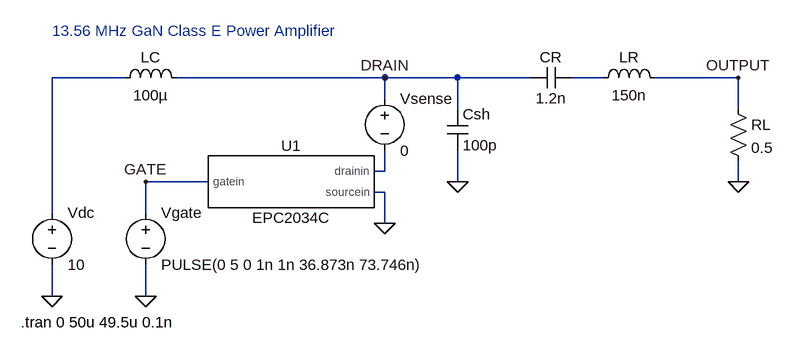
[diagram p0: schematic Class E amplifier.asc]
Class E amplifier.asc, the LTspice schematic file:
Version 4
SHEET 1 1396 680
WIRE 128 -16 16 -16
WIRE 528 -16 208 -16
WIRE 640 -16 528 -16
WIRE 752 -16 640 -16
WIRE 864 -16 816 -16
WIRE 1072 -16 944 -16
WIRE 528 16 528 -16
WIRE 640 32 640 -16
WIRE 1072 32 1072 -16
WIRE 528 128 528 96
WIRE 528 128 512 128
WIRE 256 144 160 144
WIRE 640 144 640 96
WIRE 1072 144 1072 112
WIRE 528 160 512 160
WIRE 16 192 16 -16
WIRE 160 192 160 144
WIRE 528 208 528 160
WIRE 16 320 16 272
WIRE 160 320 160 272
FLAG 160 320 0
FLAG 16 320 0
FLAG 640 144 0
FLAG 528 208 0
FLAG 1072 144 0
FLAG 528 -16 DRAIN
FLAG 160 144 GATE
FLAG 1072 -16 OUTPUT
DATAFLAG 256 -16 ""
SYMBOL voltage 160 176 R0
WINDOW 123 0 0 Left 0
WINDOW 39 0 0 Left 0
SYMATTR InstName Vgate
SYMATTR Value PULSE(0 5 0 1n 1n 36.873n 73.746n)
SYMBOL voltage 16 176 R0
WINDOW 123 0 0 Left 0
WINDOW 39 0 0 Left 0
SYMATTR InstName Vdc
SYMATTR Value 10
SYMBOL ind 112 0 R270
WINDOW 0 32 56 VTop 2
WINDOW 3 5 56 VBottom 2
SYMATTR InstName LC
SYMATTR Value 100µ
SYMBOL cap 624 32 R0
SYMATTR InstName Csh
SYMATTR Value 100p
SYMBOL cap 816 -32 R90
WINDOW 0 0 32 VBottom 2
WINDOW 3 32 32 VTop 2
SYMATTR InstName CR
SYMATTR Value 1.2n
SYMBOL ind 848 0 R270
WINDOW 0 32 56 VTop 2
WINDOW 3 5 56 VBottom 2
SYMATTR InstName LR
SYMATTR Value 150n
SYMBOL res 1056 16 R0
SYMATTR InstName RL
SYMATTR Value 0.5
SYMBOL EPC2034C 384 144 R0
SYMATTR InstName U1
SYMBOL voltage 528 0 R0
WINDOW 123 0 0 Left 0
WINDOW 39 0 0 Left 0
SYMATTR InstName Vsense
SYMATTR Value 0
TEXT -32 360 Left 2 !.tran 0 50u 49.5u 0.1n
TEXT 16 -88 Left 2 ;13.56 MHz GaN Class E Power Amplifier

The netlist it stands for:
* Class E amplifier.asc
Vgate GATE 0 PULSE(0 5 0 1n 1n 36.873n 73.746n)
Vdc N001 0 10
LC N001 DRAIN 100µ
Csh DRAIN 0 100p
CR N002 DRAIN 1.2n
LR N002 OUTPUT 150n
RL OUTPUT 0 0.5
XU1 GATE N003 0 EPC2034C  ; pins gatein drainin sourcein
Vsense DRAIN N003 0
.tran 0 50u 49.5u 0.1n
* 13.56 MHz GaN Class E Power Amplifier
.lib EPCGaNLibrary.lib
.backanno
.end